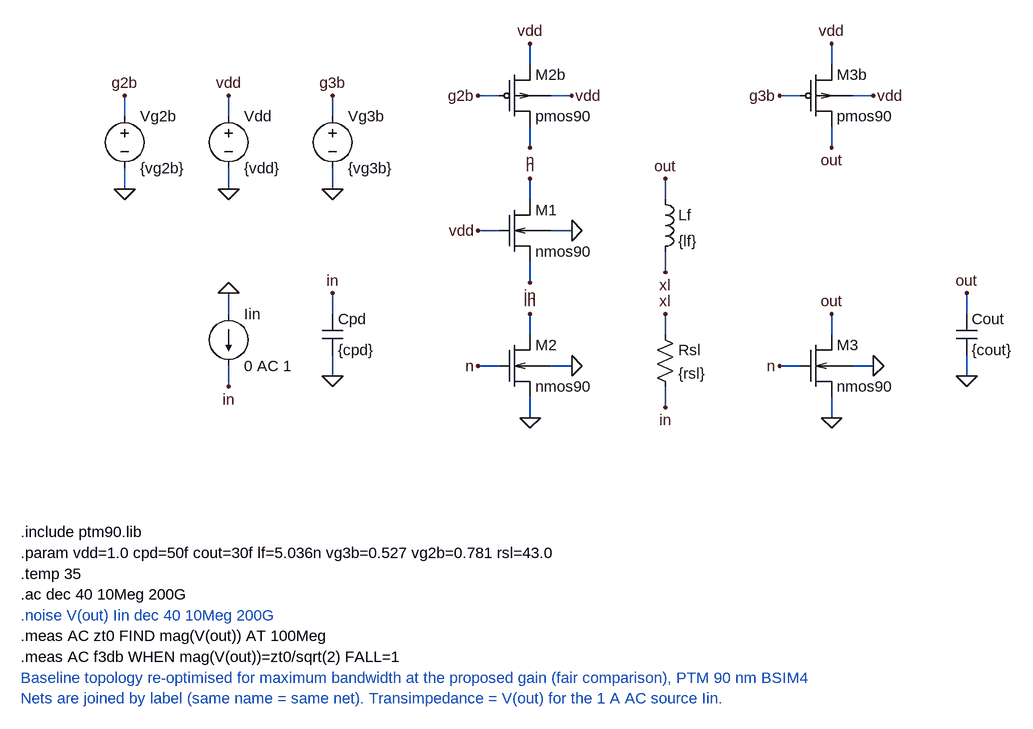
[diagram p0: schematic baseline_reopt_gain.asc]
baseline_reopt_gain.asc, the LTspice schematic file:
Version 4
SHEET 1 2200 1200
WIRE -560 80 -560 48
WIRE -560 160 -560 192
WIRE -400 80 -400 48
WIRE -400 160 -400 192
WIRE -240 80 -240 48
WIRE -240 160 -240 192
WIRE 64 96 64 128
WIRE 16 48 -16 48
WIRE 64 0 64 -32
WIRE 96 48 128 48
WIRE 64 208 64 176
WIRE 16 256 -16 256
WIRE 64 304 64 336
WIRE 96 256 128 256
WIRE 64 416 64 384
WIRE 16 464 -16 464
WIRE 64 512 64 544
WIRE 96 464 128 464
WIRE 528 416 528 384
WIRE 480 464 448 464
WIRE 528 512 528 544
WIRE 560 464 592 464
WIRE 528 96 528 128
WIRE 480 48 448 48
WIRE 528 0 528 -32
WIRE 560 48 592 48
WIRE 272 208 272 176
WIRE 272 288 272 320
WIRE 272 416 272 384
WIRE 272 496 272 528
WIRE -240 384 -240 352
WIRE -240 448 -240 480
WIRE 736 384 736 352
WIRE 736 448 736 480
WIRE -400 384 -400 352
WIRE -400 464 -400 496
FLAG -560 48 g2b
FLAG -560 192 0
FLAG -400 48 vdd
FLAG -400 192 0
FLAG -240 48 g3b
FLAG -240 192 0
FLAG 64 128 n
FLAG -16 48 g2b
FLAG 64 -32 vdd
FLAG 128 48 vdd
FLAG 64 176 n
FLAG -16 256 vdd
FLAG 64 336 in
FLAG 128 256 0
FLAG 64 384 in
FLAG -16 464 n
FLAG 64 544 0
FLAG 128 464 0
FLAG 528 384 out
FLAG 448 464 n
FLAG 528 544 0
FLAG 592 464 0
FLAG 528 128 out
FLAG 448 48 g3b
FLAG 528 -32 vdd
FLAG 592 48 vdd
FLAG 272 176 out
FLAG 272 320 xl
FLAG 272 384 xl
FLAG 272 528 in
FLAG -240 352 in
FLAG -240 480 0
FLAG 736 352 out
FLAG 736 480 0
FLAG -400 352 0
FLAG -400 496 in
SYMBOL voltage -560 64 R0
SYMATTR InstName Vg2b
SYMATTR Value {vg2b}
SYMBOL voltage -400 64 R0
SYMATTR InstName Vdd
SYMATTR Value {vdd}
SYMBOL voltage -240 64 R0
SYMATTR InstName Vg3b
SYMATTR Value {vg3b}
SYMBOL tia_pmos4 16 0 R0
SYMATTR InstName M2b
SYMATTR Value pmos90
SYMATTR Value2 l=90n w=4.64u ad=0.928p as=0.928p pd=9.68u ps=9.68u
SYMBOL tia_nmos4 16 208 R0
SYMATTR InstName M1
SYMATTR Value nmos90
SYMATTR Value2 l=90n w=1.05u ad=0.21p as=0.21p pd=2.5u ps=2.5u
SYMBOL tia_nmos4 16 416 R0
SYMATTR InstName M2
SYMATTR Value nmos90
SYMATTR Value2 l=90n w=7.22u ad=1.444p as=1.444p pd=14.84u ps=14.84u
SYMBOL tia_nmos4 480 416 R0
SYMATTR InstName M3
SYMATTR Value nmos90
SYMATTR Value2 l=90n w=1.68u ad=0.336p as=0.336p pd=3.76u ps=3.76u
SYMBOL tia_pmos4 480 0 R0
SYMATTR InstName M3b
SYMATTR Value pmos90
SYMATTR Value2 l=90n w=1.73u ad=0.346p as=0.346p pd=3.86u ps=3.86u
SYMBOL ind 256 192 R0
SYMATTR InstName Lf
SYMATTR Value {lf}
SYMBOL res 256 400 R0
SYMATTR InstName Rsl
SYMATTR Value {rsl}
SYMBOL cap -256 384 R0
SYMATTR InstName Cpd
SYMATTR Value {cpd}
SYMBOL cap 720 384 R0
SYMATTR InstName Cout
SYMATTR Value {cout}
SYMBOL current -400 384 R0
SYMATTR InstName Iin
SYMATTR Value 0 AC 1
TEXT -720 720 Left 2 !.include ptm90.lib
TEXT -720 752 Left 2 !.param vdd=1.0 cpd=50f cout=30f lf=5.036n vg3b=0.527 vg2b=0.781 rsl=43.0
TEXT -720 784 Left 2 !.temp 35
TEXT -720 816 Left 2 !.ac dec 40 10Meg 200G
TEXT -720 848 Left 2 ;.noise V(out) Iin dec 40 10Meg 200G
TEXT -720 880 Left 2 !.meas AC zt0 FIND mag(V(out)) AT 100Meg
TEXT -720 912 Left 2 !.meas AC f3db WHEN mag(V(out))=zt0/sqrt(2) FALL=1
TEXT -720 944 Left 2 ;Baseline topology re-optimised for maximum bandwidth at the proposed gain (fair comparison), PTM 90 nm BSIM4
TEXT -720 976 Left 2 ;Nets are joined by label (same name = same net). Transimpedance = V(out) for the 1 A AC source Iin.

The netlist it stands for:
* baseline_reopt_gain.asc
Vg2b g2b 0 {vg2b}
Vdd vdd 0 {vdd}
Vg3b g3b 0 {vg3b}
M2b n g2b vdd vdd pmos90 l=90n w=4.64u ad=0.928p as=0.928p pd=9.68u ps=9.68u
M1 n vdd in 0 nmos90 l=90n w=1.05u ad=0.21p as=0.21p pd=2.5u ps=2.5u
M2 in n 0 0 nmos90 l=90n w=7.22u ad=1.444p as=1.444p pd=14.84u ps=14.84u
M3 out n 0 0 nmos90 l=90n w=1.68u ad=0.336p as=0.336p pd=3.76u ps=3.76u
M3b out g3b vdd vdd pmos90 l=90n w=1.73u ad=0.346p as=0.346p pd=3.86u ps=3.86u
Lf out xl {lf}
Rsl xl in {rsl}
Cpd in 0 {cpd}
Cout out 0 {cout}
Iin 0 in 0 AC 1
.model NMOS NMOS
.model PMOS PMOS
.lib standard.mos
.include ptm90.lib
.param vdd=1.0 cpd=50f cout=30f lf=5.036n vg3b=0.527 vg2b=0.781 rsl=43.0
.temp 35
.ac dec 40 10Meg 200G
* .noise V(out) Iin dec 40 10Meg 200G
.meas AC zt0 FIND mag(V(out)) AT 100Meg
.meas AC f3db WHEN mag(V(out))=zt0/sqrt(2) FALL=1
* Baseline topology re-optimised for maximum bandwidth at the proposed gain (fair comparison), PTM 90 nm BSIM4
* Nets are joined by label (same name = same net). Transimpedance = V(out) for the 1 A AC source Iin.
.backanno
.end